# Altium schematic sheet FPGA_CFG_MGT.SchDoc
size 297 x 209 mm
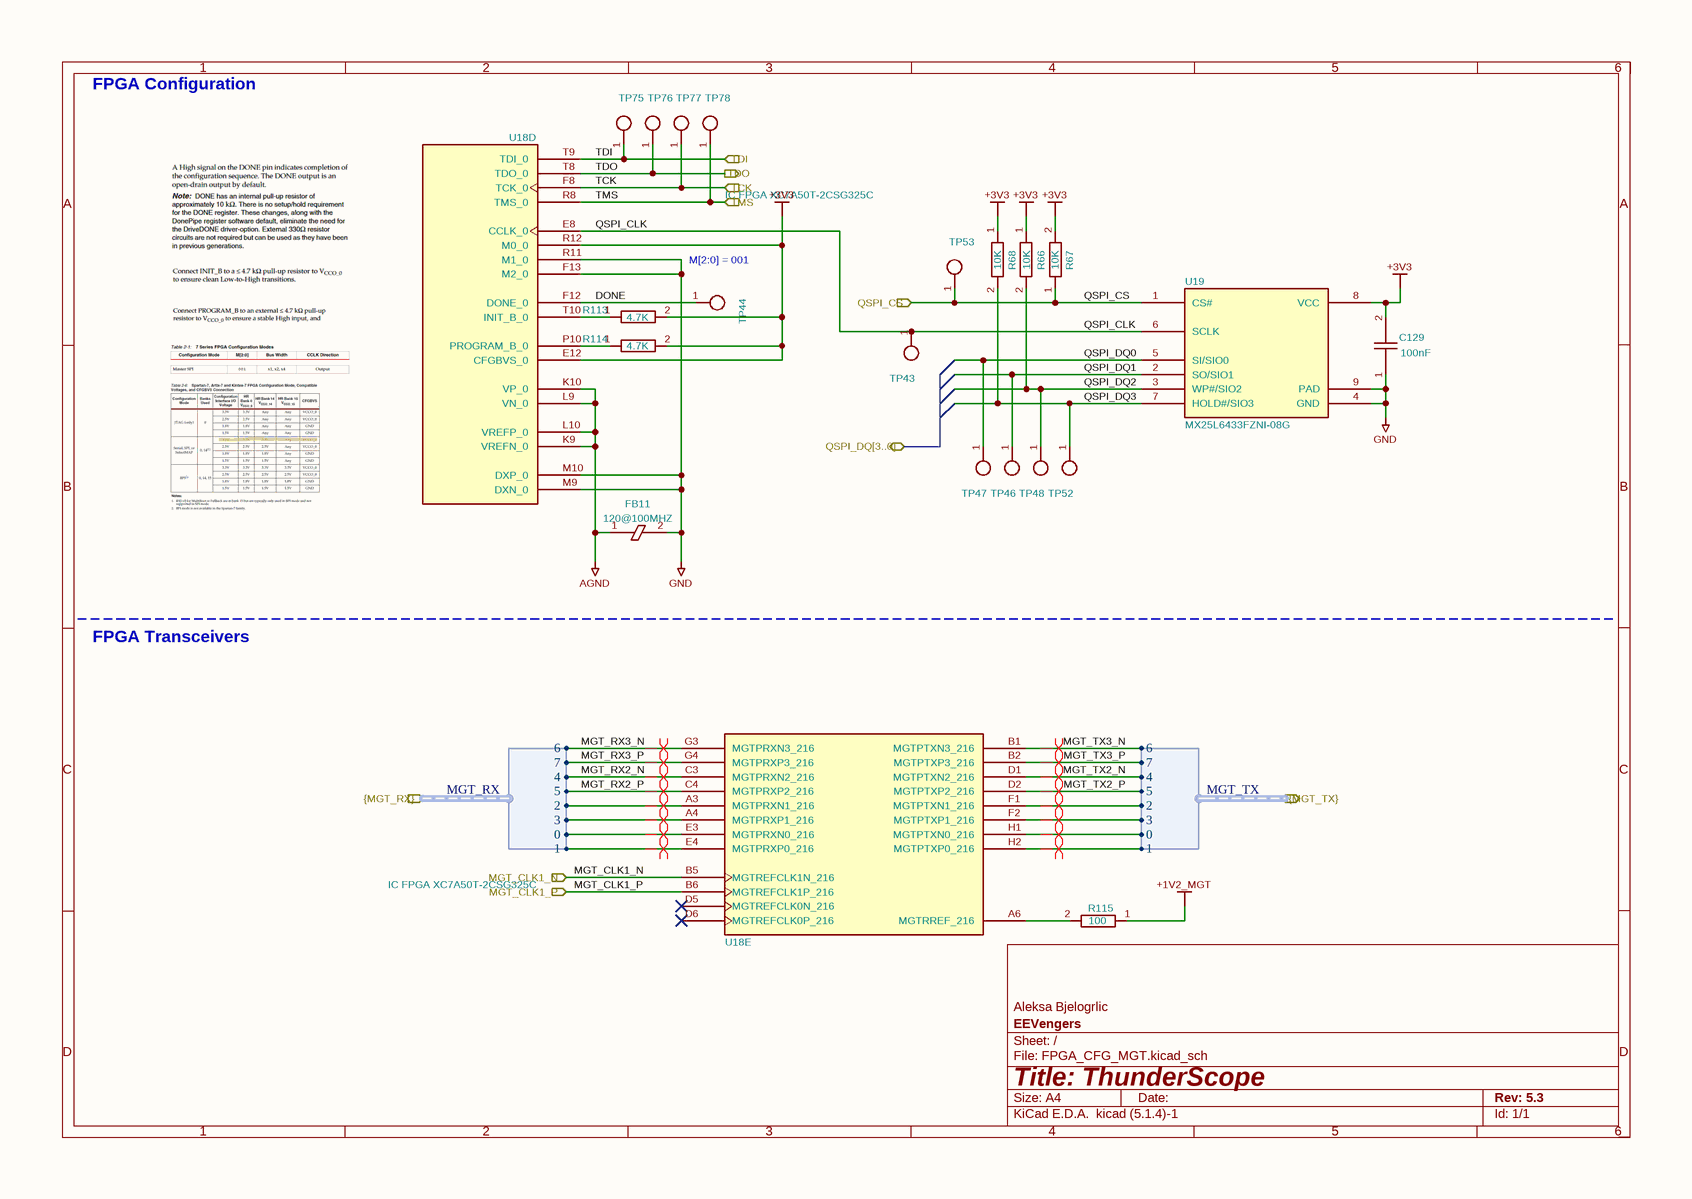
[diagram p0: FPGA_CFG_MGT.SchDoc]

## Parts
C129  100nF  [GEN_C_0402]
FB11  120@100MHZ  [GEN_R_0402]
R66  10K  [GEN_R_0402]
R67  10K  [GEN_R_0402]
R68  10K  [GEN_R_0402]
R113  4.7K  [GEN_R_0402]
R114  4.7K  [GEN_R_0402]
R115  100  [GEN_R_0402]
TP43  PCB  [GEN_TP_PCB]  (value not drawn)
TP44  PCB  [GEN_TP_PCB]  (value not drawn)
TP46  PCB  [GEN_TP_PCB]  (value not drawn)
TP47  PCB  [GEN_TP_PCB]  (value not drawn)
TP48  PCB  [GEN_TP_PCB]  (value not drawn)
TP52  PCB  [GEN_TP_PCB]  (value not drawn)
TP53  PCB  [GEN_TP_PCB]  (value not drawn)
TP75  PCB  [GEN_TP_PCB]  (value not drawn)
TP76  PCB  [GEN_TP_PCB]  (value not drawn)
TP77  PCB  [GEN_TP_PCB]  (value not drawn)
TP78  PCB  [GEN_TP_PCB]  (value not drawn)
U18  IC FPGA XC7A50T-2CSG325C  [XILINX_XC7A50T-2CSG325C]  (parts D,E of 9)
U19  MX25L6433FZNI-08G  [MX_WSON8]

## Ports
MGT_CLK1_N (in), MGT_CLK1_P (in), QSPI_CS (in), QSPI_DQ[3..0] (bidir), TCK (in), TDI (in), TDO (out), TMS (in), {MGT_RX} (in, harness MGT_RX), {MGT_TX} (out, harness MGT_TX)

## Harnesses
MGT_TX: 0, 1, 2, 3, 4, 5, 6, 7
MGT_RX: 0, 1, 2, 3, 4, 5, 6, 7

## Nets
+1V2_MGT: R115.1
+3V3: C129.2 R66.1 R67.2 R68.1 R113.2 R114.2 U18.E12(CFGBVS_0) U18.R12(M0_0) U19.8(VCC)
AGND: FB11.1 U18.K9(VREFN_0) U18.K10(VP_0) U18.L9(VN_0) U18.L10(VREFP_0)
GND: C129.1 FB11.2 U18.F13(M2_0) U18.M9(DXN_0) U18.M10(DXP_0) U18.R11(M1_0) U19.4(GND) U19.9(PAD)
DONE: TP44.1 U18.F12(DONE_0)
MGT_CLK1_N: U18.B5(MGTREFCLK1N_216) ; port MGT_CLK1_N
MGT_CLK1_P: U18.B6(MGTREFCLK1P_216) ; port MGT_CLK1_P
MGT_RX2_N: U18.C3(MGTPRXN2_216) ; port {MGT_RX}.4
MGT_RX2_P: U18.C4(MGTPRXP2_216) ; port {MGT_RX}.5
MGT_RX3_N: U18.G3(MGTPRXN3_216) ; port {MGT_RX}.6
MGT_RX3_P: U18.G4(MGTPRXP3_216) ; port {MGT_RX}.7
MGT_TX2_N: U18.D1(MGTPTXN2_216) ; port {MGT_TX}.4
MGT_TX2_P: U18.D2(MGTPTXP2_216) ; port {MGT_TX}.5
MGT_TX3_N: U18.B1(MGTPTXN3_216) ; port {MGT_TX}.6
MGT_TX3_P: U18.B2(MGTPTXP3_216) ; port {MGT_TX}.7
QSPI_CLK: TP43.1 U18.E8(CCLK_0) U19.6(SCLK)
QSPI_CS: R67.1 TP53.1 U19.1(CS#) ; port QSPI_CS
QSPI_DQ0: TP47.1 U19.5(SI/SIO0)
QSPI_DQ1: TP46.1 U19.2(SO/SIO1)
QSPI_DQ2: R66.2 TP48.1 U19.3(WP#/SIO2)
QSPI_DQ3: R68.2 TP52.1 U19.7(HOLD#/SIO3)
TCK: TP77.1 U18.F8(TCK_0) ; port TCK
TDI: TP75.1 U18.T9(TDI_0) ; port TDI
TDO: TP76.1 U18.T8(TDO_0) ; port TDO
TMS: TP78.1 U18.R8(TMS_0) ; port TMS
NetR113_1: R113.1 U18.T10(INIT_B_0)
NetR114_1: R114.1 U18.P10(PROGRAM_B_0)
NetR115_2: R115.2 U18.A6(MGTRREF_216)
NetU18_A3: U18.A3(MGTPRXN1_216) ; port {MGT_RX}.2
NetU18_A4: U18.A4(MGTPRXP1_216) ; port {MGT_RX}.3
NetU18_E3: U18.E3(MGTPRXN0_216) ; port {MGT_RX}.0
NetU18_E4: U18.E4(MGTPRXP0_216) ; port {MGT_RX}.1
NetU18_F1: U18.F1(MGTPTXN1_216) ; port {MGT_TX}.2
NetU18_F2: U18.F2(MGTPTXP1_216) ; port {MGT_TX}.3
NetU18_H1: U18.H1(MGTPTXN0_216) ; port {MGT_TX}.0
NetU18_H2: U18.H2(MGTPTXP0_216) ; port {MGT_TX}.1

Not connected (* = marked no-connect by the designer): U18 D5(MGTREFCLK0N_216)* D6(MGTREFCLK0P_216)*

## Layout directives
differential pair; differential pair class PCIe: MGT_RX2_N, MGT_RX2_P, MGT_RX3_N, MGT_RX3_P, MGT_TX2_N, MGT_TX2_P, MGT_TX3_N, MGT_TX3_P, NetU18_A3, NetU18_A4, NetU18_E3, NetU18_E4, NetU18_F1, NetU18_F2, NetU18_H1, NetU18_H2

## Notes on the sheet
- FPGA Configuration
- (near TP44) M[2:0] = 001
- FPGA Transceivers
- 1
- 2
- 3
- 4
- 5
- 6
- A
- B
- C
- Aleksa Bjelogrlic
- D
- Title: ThunderScope
- File: FPGA_CFG_MGT.kicad_sch
- Sheet: /
- EEVengers
- KiCad E.D.A.  kicad (5.1.4)-1
- Size: A4
- Date:
- Rev: 5.3
- Id: 1/1

## Library data of the parts
C129 = CAP 100nF 16V X7R 0402: HOUSE PART NUMBER: C-100nF-0402-002; MANUFACTURER: Murata; MANUFACTURER PART NUMBER: GCM155R71C104KA55D; VOLTAGE RATING: 16V; Substitutions Policy: Any Parametric Equivalent; PACKAGE: 0402; SUPPLIER 1: Mouser; SUPPLIER PART NUMBER 1: 81-GCM155R71C104KA5D; Footprint: Thunderscope_Rev5:GEN_C_0402; Value: 100nF
FB11 = FERRITE BEAD 120 OHM 0402: HOUSE PART NUMBER: BLM15PX121SN1D; MANUFACTURER: Murata; Substitutions Policy: No Substitutions; SUPPLIER 1: Mouser; SUPPLIER PART NUMBER 1: 81-BLM15PX121SN1D; MANUFACTURER PART NUMBER: BLM15PX121SN1D; PACKAGE: 0402; Footprint: Thunderscope_Rev5:GEN_R_0402; Value: 120@100MHZ
R66-R68 = RES 10K OHM 1% 1/16W 0402: MANUFACTURER: Yageo; MANUFACTURER PART NUMBER: RC0402FR-0710KL; TOLERANCE: 1%; Substitutions Policy: Any Parametric Equivalent; PACKAGE: 0402; SUPPLIER 1: Mouser; SUPPLIER PART NUMBER 1: 603-RC0402FR-0710KL; Footprint: Thunderscope_Rev5:GEN_R_0402; Value: 10K
R113 R114 = RES 4.7K OHM 1% 1/16W 0402: MANUFACTURER: Yageo; MANUFACTURER PART NUMBER: RC0402FR-074K7L; TOLERANCE: 1%; Substitutions Policy: Any Parametric Equivalent; PACKAGE: 0402; SUPPLIER 1: Mouser; SUPPLIER PART NUMBER 1: 603-RC0402FR-074K7L; Footprint: Thunderscope_Rev5:GEN_R_0402; Value: 4.7K
R115 = RES 100 OHM 1% 1/10W 0402: MANUFACTURER: Yageo; MANUFACTURER PART NUMBER: RC0402FR-07100RL; TOLERANCE: 1%; Substitutions Policy: Any Parametric Equivalent; PACKAGE: 0402; SUPPLIER 1: Mouser; SUPPLIER PART NUMBER 1: 603-RC0402FR-07100RL; Footprint: Thunderscope_Rev5:GEN_R_0402; Value: 100
TP43 TP44 TP46-TP48 TP52 TP53 TP75-TP78 = TP PCB 1mm: Footprint: Thunderscope_Rev5:GEN_TP_PCB; Value: PCB
U18 = IC FPGA XC7A50T-2CSG325C: MANUFACTURER: Xilinx; Substitutions Policy: No Substitutions; HOUSE PART NUMBER: XC7A50T-2CSG325C; MANUFACTURER PART NUMBER: XC7A50T-2CSG325C; SUPPLIER 1: Digi-Key; SUPPLIER PART NUMBER 1: 122-2193-ND; PACKAGE: 324-BGA (15x15mm); Value: IC FPGA XC7A50T-2CSG325C; Footprint: Thunderscope_Rev5:XILINX_XC7A50T-2CSG325C
U19 = IC FLASH MX25L6433FZNI-08G: HOUSE PART NUMBER: MX25L6433FZNI-08G-TR; MANUFACTURER: Macronix; Substitutions Policy: ECO Required for Substitution; SUPPLIER 1: Mouser; SUPPLIER PART NUMBER 1: 95-25L6433FZNI08TR; MANUFACTURER PART NUMBER: MX25L6433FZNI-08G-TR; PACKAGE: 8-WSON (6x5mm); Value: MX25L6433FZNI-08G; Footprint: Thunderscope_Rev5:MX_WSON8